# Altium schematic sheet DXES101B-659637-COMM-PORTS.SchDoc
size A3; Organization: Altium Limited; Address1: 3 Minna Close; Address2: Belrose; Address3: NSW 2085; Address4: Australia; SheetNumber: 8; SheetTotal: 10
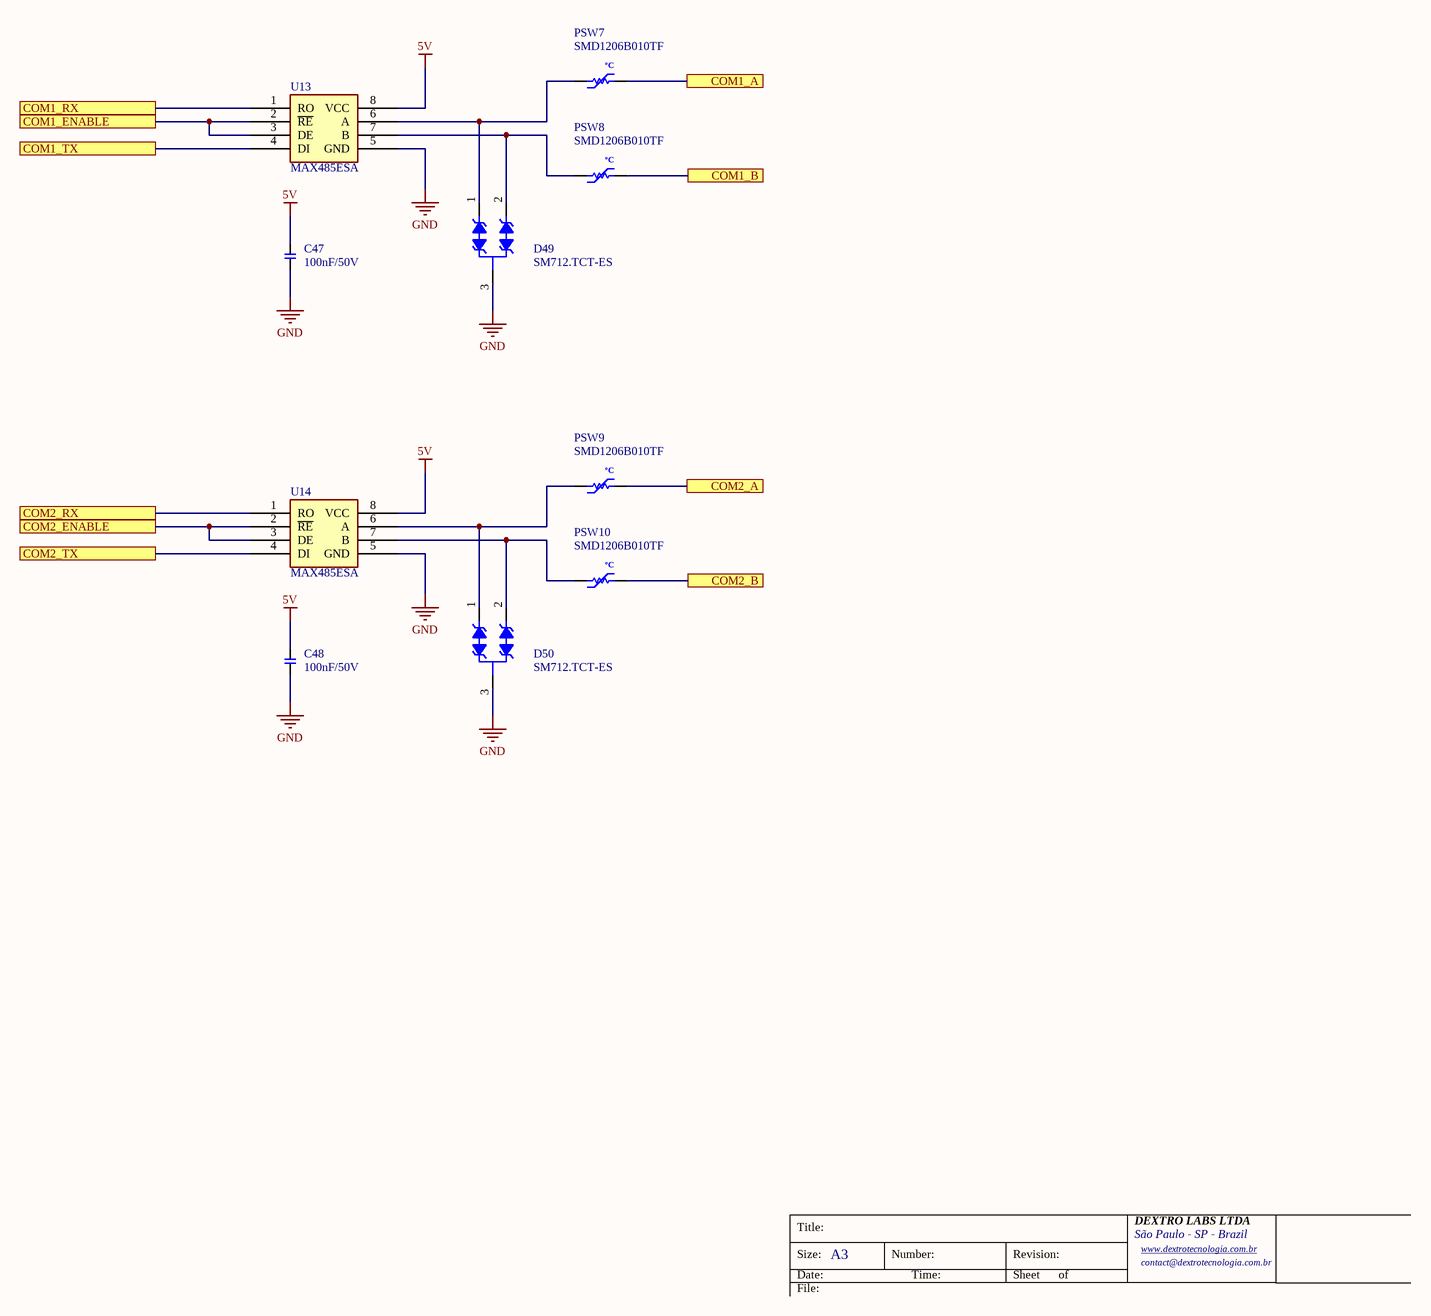
[diagram p0: DXES101B-659637-COMM-PORTS.SchDoc]

## Parts
C47  100nF/50V  [CAP-0603]
C48  100nF/50V  [CAP-0603]
D49  SM712.TCT-ES  [SOT23-3]
D50  SM712.TCT-ES  [SOT23-3]
PSW7  SMD1206B010TF  [RES-1206]
PSW8  SMD1206B010TF  [RES-1206]
PSW9  SMD1206B010TF  [RES-1206]
PSW10  SMD1206B010TF  [RES-1206]
U13  MAX485ESA  [SOIC-08]
U14  MAX485ESA  [SOIC-08]

## Ports
COM1_A (see DXES101B-659637-GENERAL[4C]), COM1_B (see DXES101B-659637-GENERAL[4C]), COM1_ENABLE (see DXES101B-659637-GENERAL[3C], DXES101B-659637-POWER-AND-SIGNALS[2C]), COM1_RX (see DXES101B-659637-GENERAL[3C], DXES101B-659637-POWER-AND-SIGNALS[3C]), COM1_TX (see DXES101B-659637-GENERAL[3C], DXES101B-659637-POWER-AND-SIGNALS[2C]), COM2_A (see DXES101B-659637-GENERAL[4C]), COM2_B (see DXES101B-659637-GENERAL[4C]), COM2_ENABLE (see DXES101B-659637-GENERAL[3C], DXES101B-659637-POWER-AND-SIGNALS[3C]), COM2_RX (see DXES101B-659637-GENERAL[3C], DXES101B-659637-POWER-AND-SIGNALS[3C]), COM2_TX (see DXES101B-659637-GENERAL[3C], DXES101B-659637-POWER-AND-SIGNALS[2C])

## Nets
5V: C47.2 C48.2 U13.8(VCC) U14.8(VCC)
GND: C47.1 C48.1 D49.3(K) D50.3(K) U13.5(GND) U14.5(GND)
COM1_A: PSW7.2 ; port COM1_A
COM1_B: PSW8.2 ; port COM1_B
COM1_ENABLE: U13.2(~{RE}) U13.3(DE) ; port COM1_ENABLE
COM1_RX: U13.1(RO) ; port COM1_RX
COM1_TX: U13.4(DI) ; port COM1_TX
COM2_A: PSW9.2 ; port COM2_A
COM2_B: PSW10.2 ; port COM2_B
COM2_ENABLE: U14.2(~{RE}) U14.3(DE) ; port COM2_ENABLE
COM2_RX: U14.1(RO) ; port COM2_RX
COM2_TX: U14.4(DI) ; port COM2_TX
NetD49_1: D49.1(A1) PSW7.1 U13.6(A)
NetD49_2: D49.2(A2) PSW8.1 U13.7(B)
NetD50_1: D50.1(A1) PSW9.1 U14.6(A)
NetD50_2: D50.2(A2) PSW10.1 U14.7(B)

## Notes on the sheet
- Title:
- Size:
- Date:
- A3
- Number:
- Time:
- Revision:
- Sheet
- of
- DEXTRO LABS LTDA
- São Paulo - SP - Brazil
- www.dextrotecnologia.com.br <http://www.dextrotecnologia.com.br>
- contact@dextrotecnologia.com.br
- File:
- (in symbol SMD1206B010TF) ºC

## Library data of the parts
C47 C48 = CAP-100nF/50V-0603-X7R-MLCC: 50V 100nF X7R ±10% 0603 Multilayer Ceramic Capacitors MLCC - SMD/SMT ROHS; LCSC: C14663
D49 D50 = SM712.TCT-ES: 400W@8/20us Bidirectional SOT-23 ESD and Surge Protection (TVS/ESD) ROHS; LCSC: C22363671
PSW7-PSW10 = SMD1206B010TF: 30V 100mA 100A 270mA 1206 Resettable Fuses ROHS; LCSC: C269108
U13 U14 = MAX485ESA: Low-Power, Slew-Rate-Limited RS-485/RS-422 Transceivers; LCSC: C5279041